# Altium project ESD_Mainboard.PrjPcb (part 2 of 2)
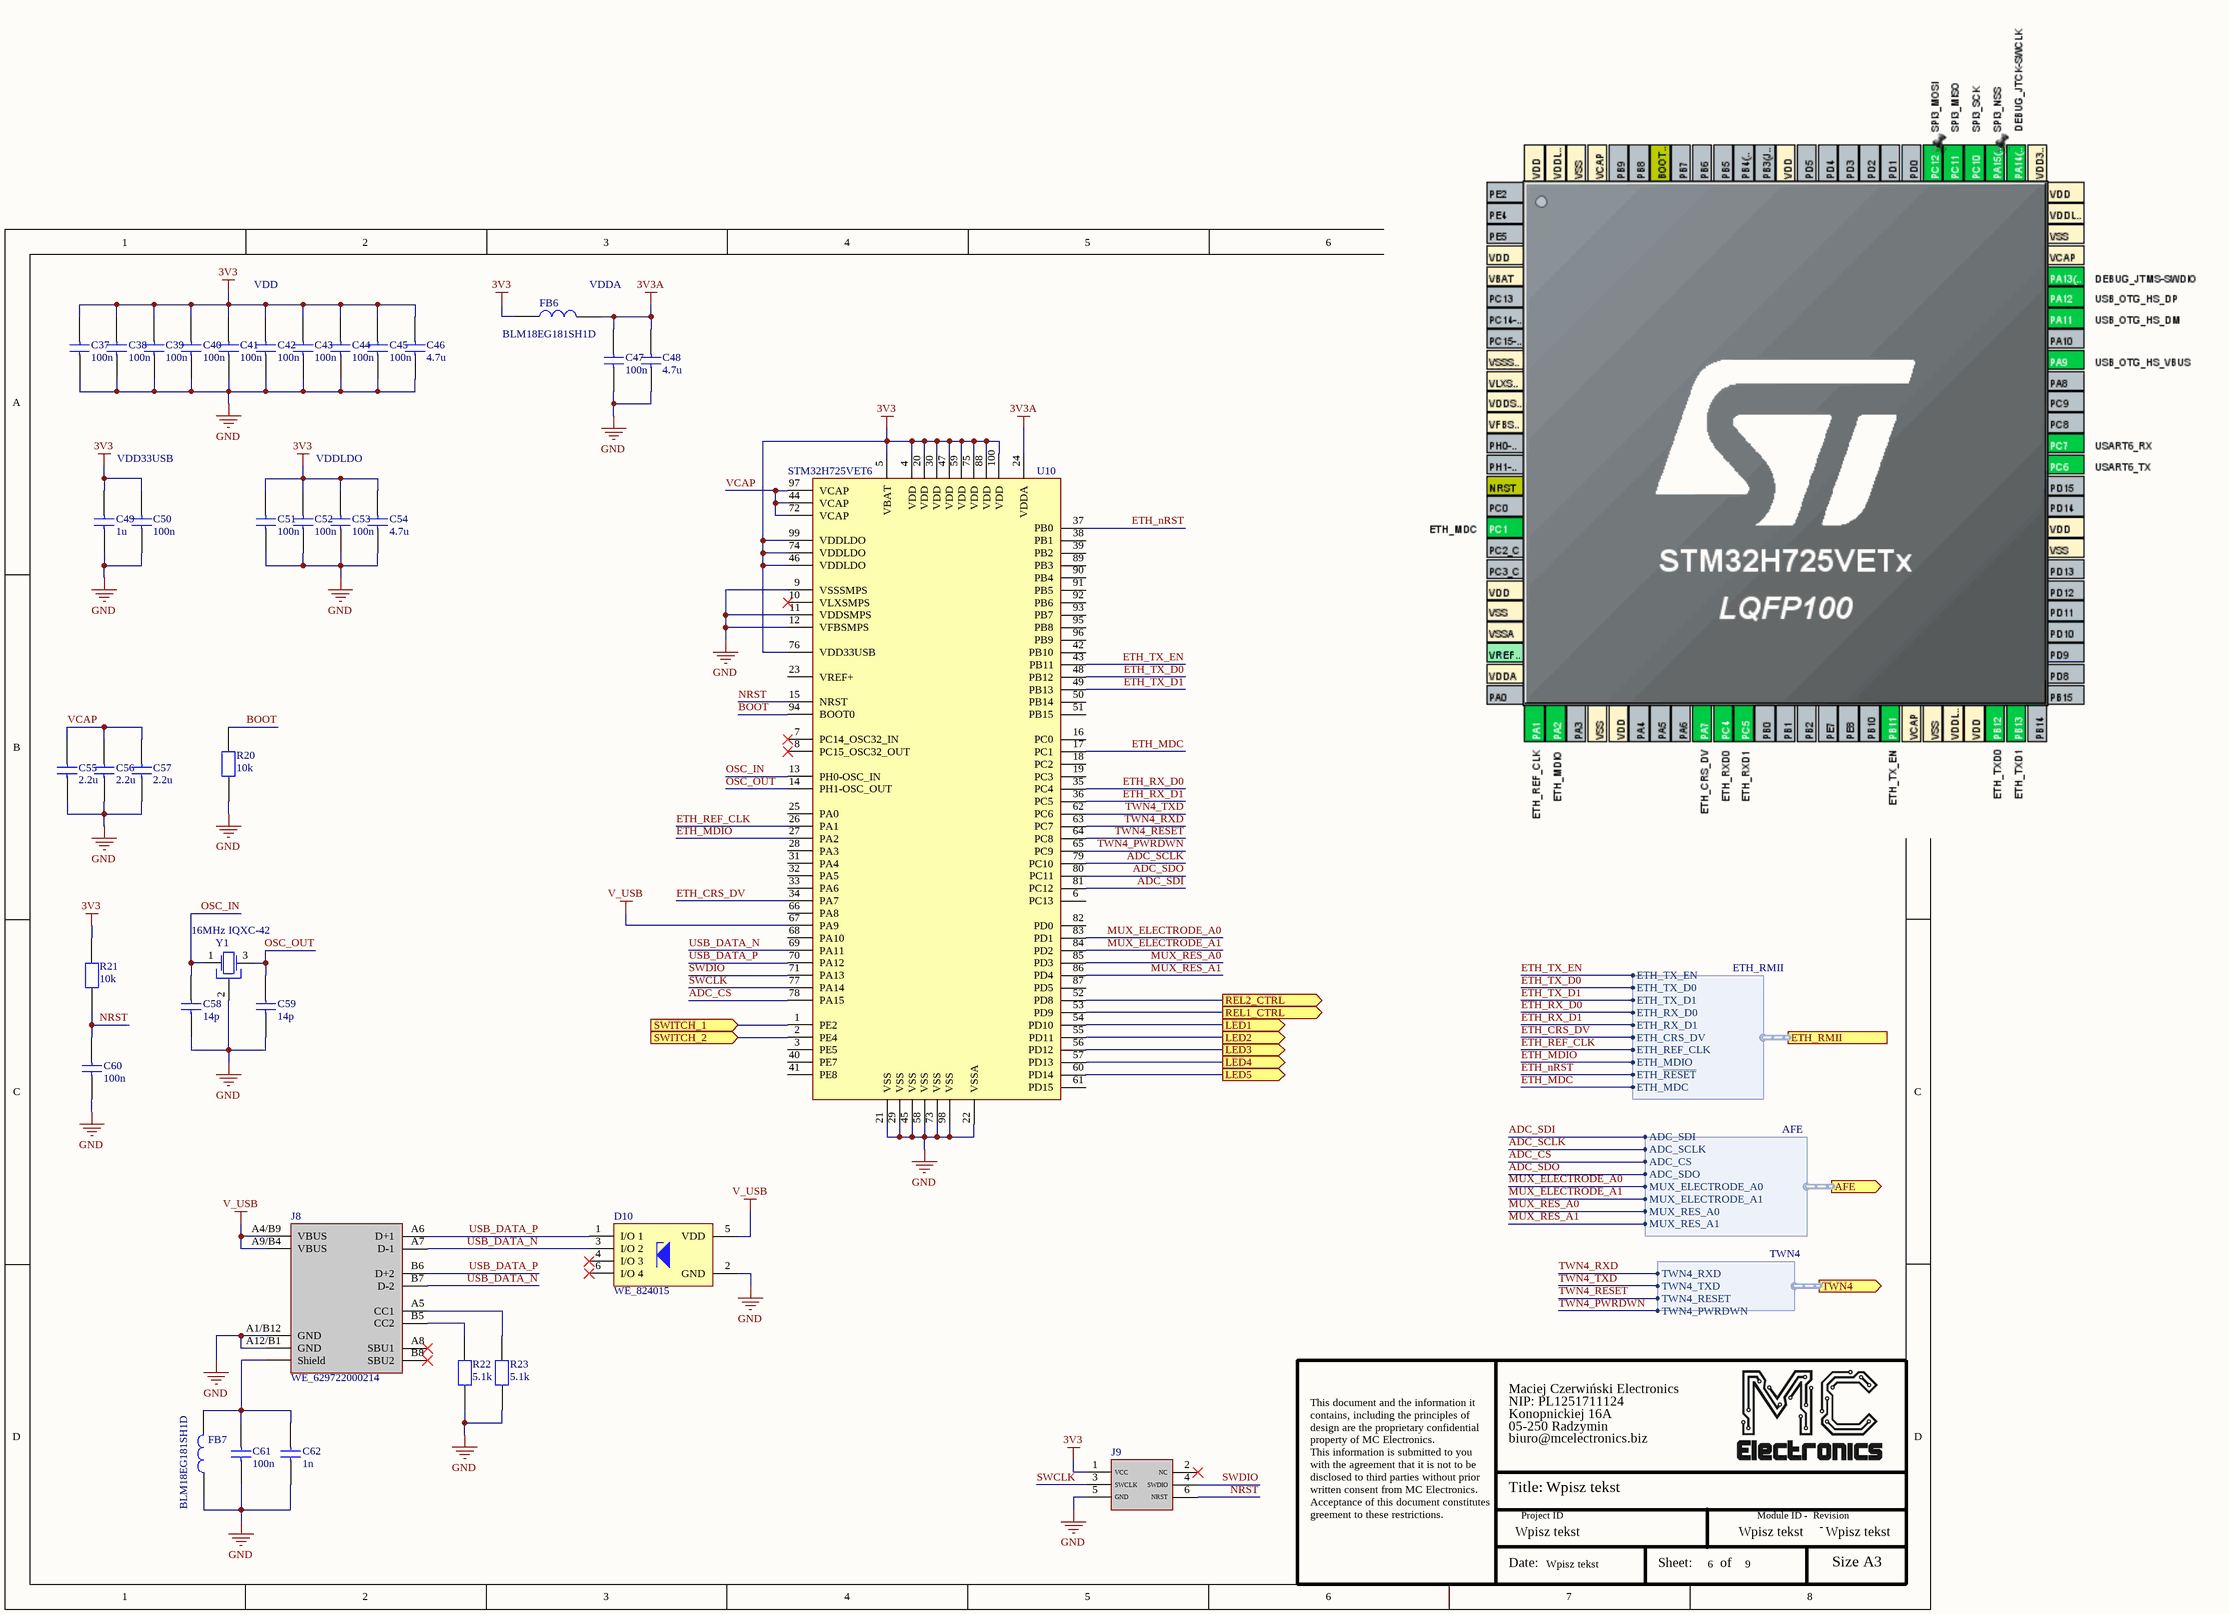
[diagram p9: MCU.SchDoc]

## Nets that join several sheets
3V3: RFID (C77.2 C78.2 U12.4), ETHERNET (9 pins), POWER_SUPPLY (C25.2 C26.2 U6.3), IOs (7 pins), ANALOG_MEASUREMENT_CIRCUIT (C13.2 U4.1 U4.7), MCU (32 pins)
3V3_ISO: POWER_SUPPLY (C32.2 C33.2 FB5.1 U9.5), ANALOG_MEASUREMENT_CIRCUIT (18 pins)
3V3A_ISO: POWER_SUPPLY (C34.2 C35.2 FB5.2), ANALOG_MEASUREMENT_CIRCUIT (5 pins), U_Main/U_ANALOG_MEASUREMENT_CIRCUIT/U_ANALOG_BUFFER (6 pins), U_Main/U_ANALOG_MEASUREMENT_CIRCUIT/U_ANALOG_BUFFER (6 pins)
12V: POWER_SUPPLY (10 pins), IOs (D12.1 D13.1 Rel1.2 Rel2.2)
12V_ISO: POWER_SUPPLY (C31.2 U8.5 U9.1 U9.3), ANALOG_MEASUREMENT_CIRCUIT (R5.1), U_Main/U_ANALOG_MEASUREMENT_CIRCUIT/U_ANALOG_BUFFER (5 pins), U_Main/U_ANALOG_MEASUREMENT_CIRCUIT/U_ANALOG_BUFFER (5 pins)
GND: Main (D1.2 J1.2), RFID (7 pins), ETHERNET (23 pins), POWER_SUPPLY (16 pins), IOs (18 pins), ANALOG_MEASUREMENT_CIRCUIT (C13.1 U4.2 U4.8), MCU (45 pins)
GND_ISO: Main (8 pins), POWER_SUPPLY (9 pins), ANALOG_MEASUREMENT_CIRCUIT (31 pins), U_Main/U_ANALOG_MEASUREMENT_CIRCUIT/U_ANALOG_BUFFER (15 pins), U_Main/U_ANALOG_MEASUREMENT_CIRCUIT/U_ANALOG_BUFFER (15 pins)
ADC_CS: ANALOG_MEASUREMENT_CIRCUIT (U4.5), MCU (U10.78)
ADC_SCLK: ANALOG_MEASUREMENT_CIRCUIT (U4.4), MCU (U10.79)
ADC_SDI: ANALOG_MEASUREMENT_CIRCUIT (U4.3), MCU (U10.81)
ADC_SDO: ANALOG_MEASUREMENT_CIRCUIT (U4.6), MCU (U10.80)
ETH_CRS_DV: ETHERNET (R32.2 U11.11), MCU (U10.34)
ETH_MDC: ETHERNET (U11.13), MCU (U10.17)
ETH_MDIO: ETHERNET (R36.2), MCU (U10.27)
ETH_nRST: ETHERNET (U11.15), MCU (U10.37)
ETH_REF_CLK: ETHERNET (R25.2 U11.14), MCU (U10.26)
ETH_RX_D0: ETHERNET (R34.2), MCU (U10.35)
ETH_RX_D1: ETHERNET (R35.2), MCU (U10.36)
ETH_TX_D0: ETHERNET (U11.17), MCU (U10.48)
ETH_TX_D1: ETHERNET (U11.18), MCU (U10.49)
ETH_TX_EN: ETHERNET (U11.16), MCU (U10.43)
MUX_ELECTRODE_A0: ANALOG_MEASUREMENT_CIRCUIT (R7.2), MCU (U10.83)
MUX_ELECTRODE_A1: ANALOG_MEASUREMENT_CIRCUIT (R8.2), MCU (U10.84)
MUX_RES_A0: ANALOG_MEASUREMENT_CIRCUIT (R10.2), MCU (U10.85)
MUX_RES_A1: ANALOG_MEASUREMENT_CIRCUIT (R11.2), MCU (U10.86)
NetC79_1: IOs (C79.1 R48.1 SW1.1), MCU (U10.1)
NetC80_1: IOs (C80.1 R49.1 SW2.1), MCU (U10.2)
NetC88A_2: U_Main/U_ANALOG_MEASUREMENT_CIRCUIT/U_ANALOG_BUFFER (C88A.2 D19A.3 R67A.1), U_Main/U_ANALOG_MEASUREMENT_CIRCUIT/U_ANALOG_BUFFER (C88B.2 D19B.3 R67B.1)
NetD21A_3: U_Main/U_ANALOG_MEASUREMENT_CIRCUIT/U_ANALOG_BUFFER (D21A.3 U14A.3), U_Main/U_ANALOG_MEASUREMENT_CIRCUIT/U_ANALOG_BUFFER (D21B.3 U14B.3)
NetR46_2: IOs (R46.2), MCU (U10.52)
NetR47_2: IOs (R47.2), MCU (U10.53)
NetR57_2: IOs (R57.2), MCU (U10.54)
NetR58_2: IOs (R58.2), MCU (U10.55)
NetR59_2: IOs (R59.2), MCU (U10.56)
NetR60_2: IOs (R60.2), MCU (U10.57)
NetR61_2: IOs (R61.2), MCU (U10.60)
TWN4_PWRDWN: RFID (R43.2), MCU (U10.65)
TWN4_RESET: RFID (R42.2), MCU (U10.64)
TWN4_RXD: RFID (U12.5), MCU (U10.63)
TWN4_TXD: RFID (U12.6), MCU (U10.62)